# EAGLE design z_gauge_decoder_v1.0 (EAGLE 9.7.0)
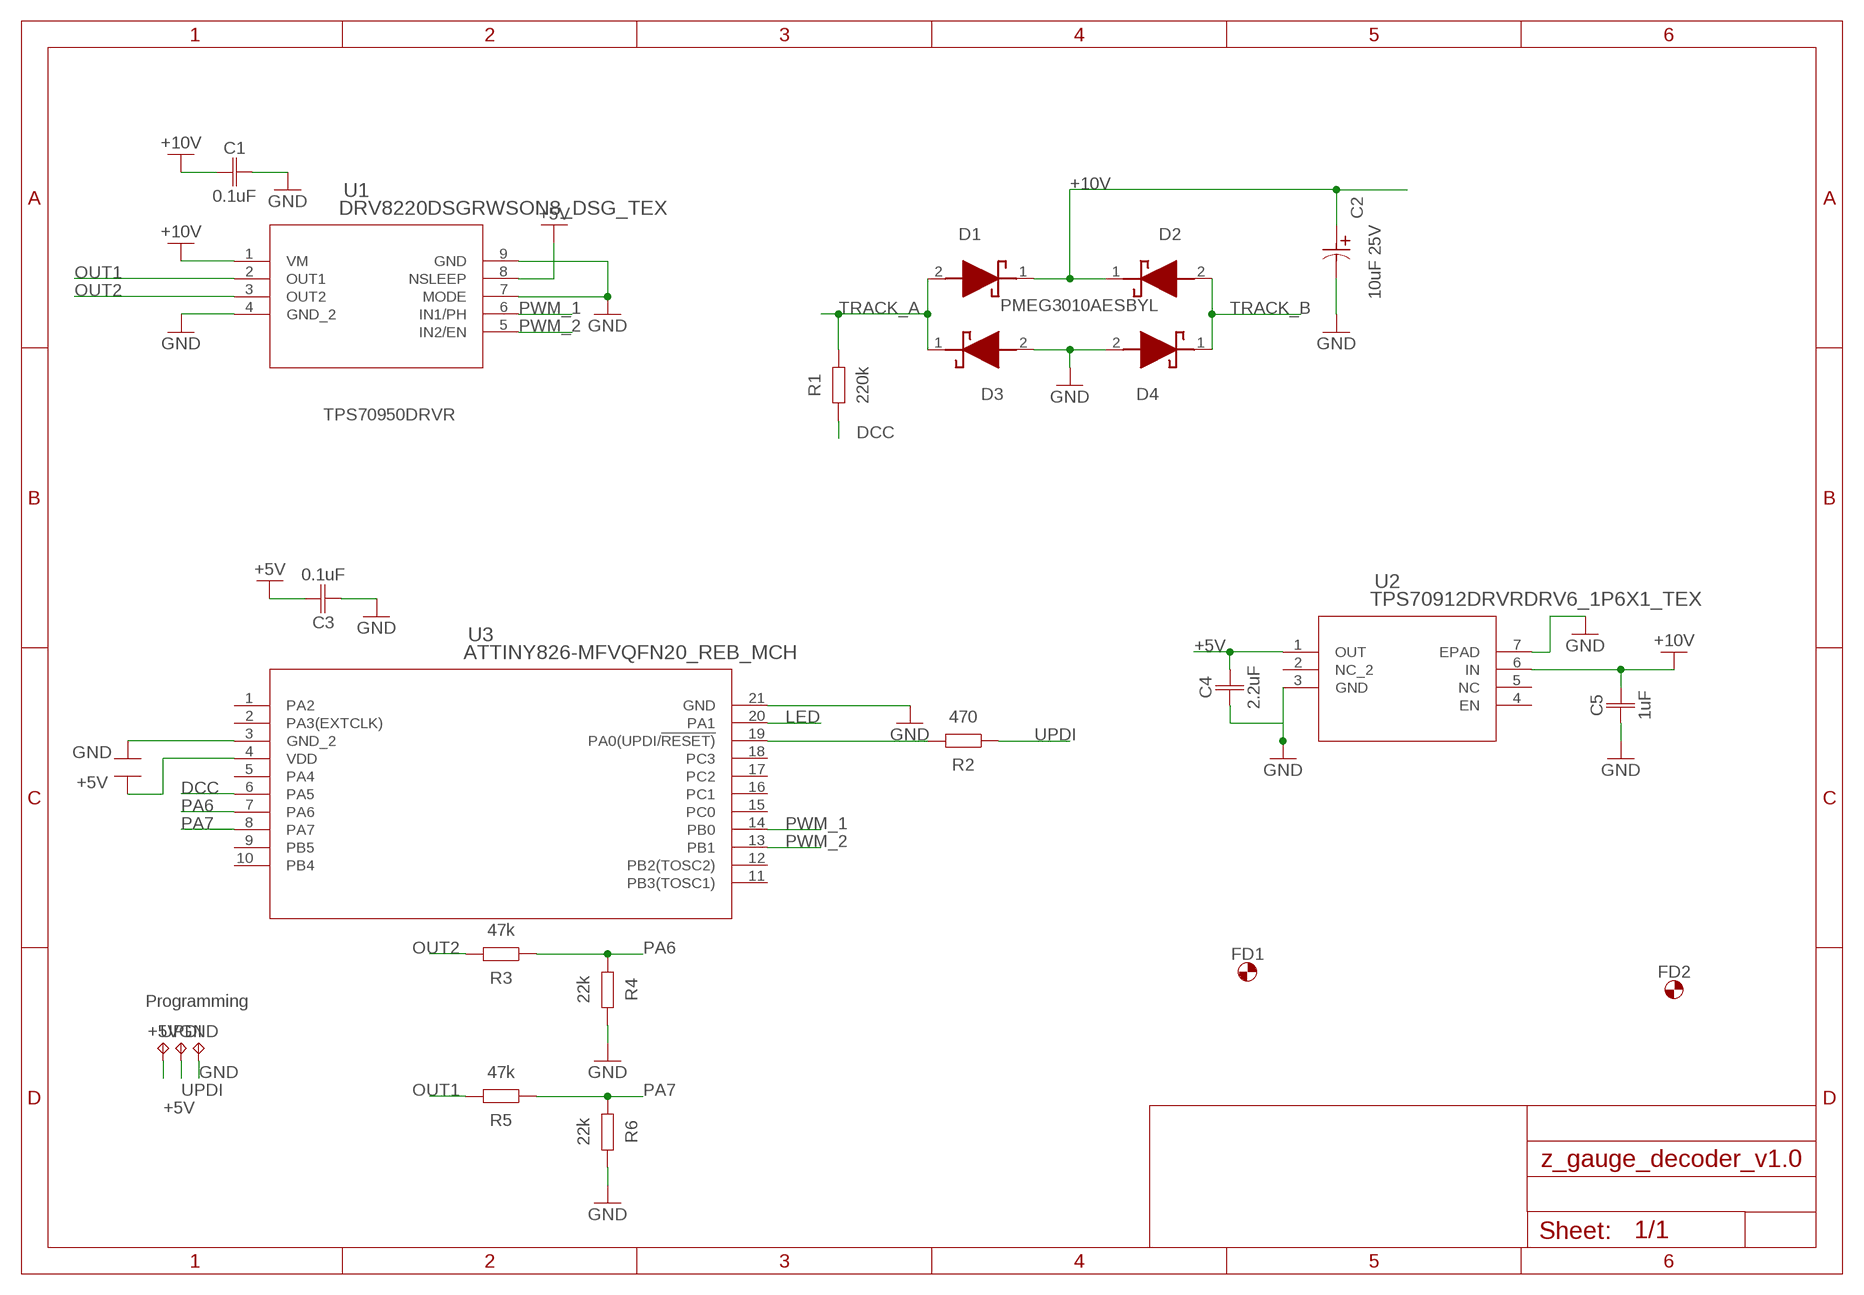
[diagram p0: schematic, sheet 1]

## Parts
+5V  TPTP127R  [TP127R]
C1  0.1uF  CCHIP-0201(0603METRIC)  [WE-MK_0201]
C2  10uF 25V  TAJA106K016RNJTAJA_AVX  [TAJA_AVX]
C3  0.1uF  CCHIP-0201(0603METRIC)  [WE-MK_0201]
C4  2.2uF  CCHIP-0201(0603METRIC)  [WE-MK_0201]
C5  1uF  CCHIP-0201(0603METRIC)  [WE-MK_0201]
D1  PMEG3010AESBYL  [PMEG3010AESBYL]
D2  PMEG3010AESBYL  [PMEG3010AESBYL]
D3  PMEG3010AESBYL  [PMEG3010AESBYL]
D4  PMEG3010AESBYL  [PMEG3010AESBYL]
FD1  FID_1MM_P  [FID_1MM_P]
FD2  FID_1MM_P  [FID_1MM_P]
GND  TPTP127R  [TP127R]
R1  220k  RCHIP-0201(0603METRIC)  [WCAP-CSGP_0201_H0.3]
R2  470  RCHIP-0201(0603METRIC)  [WCAP-CSGP_0201_H0.3]
R3  47k  RCHIP-0201(0603METRIC)  [WCAP-CSGP_0201_H0.3]
R4  22k  RCHIP-0201(0603METRIC)  [WCAP-CSGP_0201_H0.3]
R5  47k  RCHIP-0201(0603METRIC)  [WCAP-CSGP_0201_H0.3]
R6  22k  RCHIP-0201(0603METRIC)  [WCAP-CSGP_0201_H0.3]
U1  DRV8220DSGRWSON8_DSG_TEX  [WSON8_DSG_TEX]
U2  TPS70912DRVRDRV6_1P6X1_TEX  [DRV6_1P6X1_TEX]
U3  ATTINY826-MFVQFN20_REB_MCH  [VQFN20_REB_MCH]
UPDI  TPTP127R  [TP127R]

## Nets
+5V: +5V.TP C3.2 C4.2 U1.8(NSLEEP) U2.1(OUT) U3.4(VDD)
+10V: C1.1 C2.1 C5.2 D1.1(K) D2.1(K) U1.1(VM) U2.6(IN)
DCC: R1.1 U3.6(PA5)
GND: C1.2 C2.2 C3.1 C4.1 C5.1 D3.2(A) D4.2(A) GND.TP R4.2 R6.2 U1.4(GND_2) U1.7(MODE) U1.9(GND) U2.3(GND) U2.7(EPAD) U3.3(GND_2) U3.21(GND)
LED: U3.20(PA1)
N$1: R2.2 U3.19(PA0(UPDI/!RESET))
OUT1: R5.2 U1.2(OUT1)
OUT2: R3.2 U1.3(OUT2)
PA6: R3.1 R4.1 U3.7(PA6)
PA7: R5.1 R6.1 U3.8(PA7)
PWM_1: U1.6(IN1/PH) U3.14(PB0)
PWM_2: U1.5(IN2/EN) U3.13(PB1)
TRACK_A: D1.2(A) D3.1(K) R1.2
TRACK_B: D2.2(A) D4.1(K)
UPDI: R2.1 UPDI.TP
Unconnected: U2.2(NC_2) U2.4(EN) U2.5(NC) U3.1(PA2) U3.2(PA3(EXTCLK)) U3.5(PA4) U3.9(PB5) U3.10(PB4) U3.11(PB3(TOSC1)) U3.12(PB2(TOSC2)) U3.15(PC0) U3.16(PC1) U3.17(PC2) U3.18(PC3)

## Notes on the sheet
- TPS70950DRVR
- Programming

## Library data of the parts
+5V GND UPDI = PCB_Utilities:TP: Test Pad; CATEGORY_L1: Test Points; DESCRIPTION: Test Point Round 1.27mmx1.27mm
C1 C3 = Capacitor:C: Capacitor - Generic; CATEGORY_L1: Capacitor; MPN: GRM033R61E104KE14D
C2 = 2026-11-07_18-14-01_Library:TAJA106K016RNJ; COPYRIGHT: Copyright (C) 2026 Ultra Librarian. All rights reserved.; MANUFACTURER_NAME: KYOCERA AVX; MANUFACTURER_PART_NUMBER: TAJA106K016RNJ; MPN: TCJA106M025R0150E
C4 C5 = Capacitor:C: Capacitor - Generic; CATEGORY_L1: Capacitor
D1-D4 = PMEG3010AESBYL:PMEG3010AESBYL: Schottky Diodes & Rectifiers 1A MEGA Schottky Barrier Rectifier Source: Datasheet <https://assets.nexperia.com/documents/data-sheet/PMEG3010AESB.pdf>; ARROW_PART_NUMBER: PMEG3010AESBYL; ARROW_PRICE-STOCK: https://www.arrow.com/en/products/pmeg3010aesbyl/nexperia?region=nac; DESCRIPTION: Schottky Diodes & Rectifiers 1A MEGA Schottky Barrier Rectifier; HEIGHT: 0.3mm; MANUFACTURER_NAME: Nexperia; MANUFACTURER_PART_NUMBER: PMEG3010AESBYL; MOUSER_PART_NUMBER: 771-PMEG3010AESBYL; MOUSER_PRICE-STOCK: https://www.mouser.co.uk/ProductDetail/Nexperia/PMEG3010AESBYL?qs=bel5lzaZNxQRW0rEhdK%2FZQ%3D%3D
FD1 FD2 = PCB_Utilities:FID: Fiducial marks. Top and Bottom copper with stop mask; CATEGORY_L1: Fiducial Marks; DESCRIPTION: Fiducial Mark 1mm with solder paste; PACKAGE: Surface Mount
R1-R6 = Resistor:R: Resistor Fixed - Generic; CATEGORY_L1: Resistors
U1 = 2026-11-06_20-55-51_Library:DRV8220DSGR; COPYRIGHT: Copyright (C) 2026 Ultra Librarian. All rights reserved.; DATASHEET: https://www.ti.com/lit/gpn/drv8220; DESCRIPTION: 20-V, 1.76-A H-bridge motor driver with auto sleep mode 8-WSON -40 to 125; MANUFACTURER_NAME: Texas Instruments; MANUFACTURER_PART_NUMBER: DRV8220DSGR
U2 = 2026-11-06_21-08-21_Library:TPS70912DRVR; COPYRIGHT: Copyright (C) 2026 Ultra Librarian. All rights reserved.; DATASHEET: https://www.ti.com/lit/gpn/tps709; DESCRIPTION: 150-mA, 30-V, ultra-low-IQ, low-dropout voltage regulator with reverse current protection and enable 6-WSON -40 to 125; MANUFACTURER_NAME: Texas Instruments; MANUFACTURER_PART_NUMBER: TPS70912DRVR
U3 = 2026-11-06_21-22-19_Library:ATTINY826-MF; COPYRIGHT: Copyright (C) 2026 Ultra Librarian. All rights reserved.; MANUFACTURER_NAME: Microchip; MANUFACTURER_PART_NUMBER: ATTINY826-MF

## Board
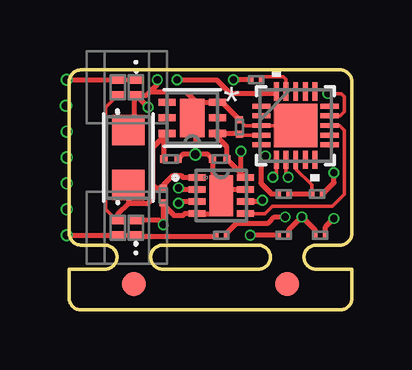
[diagram p1: board, top side]
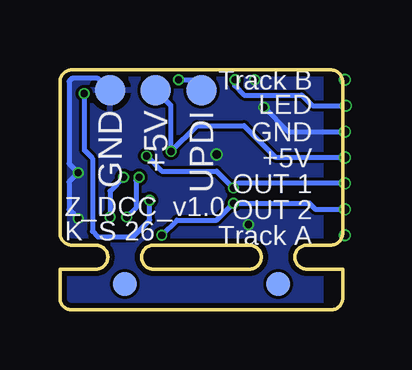
[diagram p2: board, bottom side, seen from below]

Size 11.8 x 10 mm. Coordinates in mm from the lower left corner, seen from the top.
Outline: 3.9,2.7 arc180 3.9,1.7 7.9,1.7 arc180 7.9,2.7 3.9,2.7
Outline: 11.3,2.7 arc90 11.8,3.2 11.8,9.5 arc90 11.3,10 0.5,10 arc90 0,9.5 0,3.2 arc90 0.5,2.7 1.5,2.7 arc-180 1.5,1.7 0,1.7 0,0.5 arc90 0.5,0 11.3,0 arc90 11.8,0.5 11.8,1.7 10.3,1.7 arc-180 10.3,2.7 11.3,2.7
Copper layers (1*16): Top 0.035mm / dielectric 1.6mm / Bottom 0.035mm
Design rules "jlcpcb-2layers.dru *": minimum track width 5mil, minimum drill 0.3mm, track to track 5mil, track to pad 5mil, pad to pad 5mil, via to via 5mil, smd to smd 5mil, copper to edge 0.2mm, drill to drill 6mil, minimum pad ring 10mil, minimum via ring 3mil, stop-mask expansion 4mil, vias tented up to drill 0mil, thermal gap 10mil
tRestrict: area 1.7,2.5 to 3.9,2.9

### Footprints (pad centres in the part's own frame; a part is rotated, then mirrored left to right if it is on the bottom)
TP127R = smd 1.27 x 1.27: TP 0,0
WE-MK_0201 = smd 0.3 x 0.3: 1 -0.3,0; 2 0.3,0
TAJA_AVX = smd 1.27 x 1.346: 1 -1.143,0; 2 1.143,0
PMEG3010AESBYL = smd 0.35 x 0.6: 1 -0.325,0; 2 0.325,0
FID_1MM_P = smd 1 x 1 bottom: FIDB 0,0 | smd 1 x 1: FIDT 0,0
WCAP-CSGP_0201_H0.3 = smd 0.21 x 0.3: 1 0.22,0; 2 -0.22,0
WSON8_DSG_TEX = smd 0.711 x 0.279: 1 -1.003,0.75; 2 -1.003,0.25; 3 -1.003,-0.25; 4 -1.003,-0.75; 5 1.003,-0.75; 6 1.003,-0.25; 7 1.003,0.25; 8 1.003,0.75 | smd 0.991 x 1.702: 9 0,0
DRV6_1P6X1_TEX = smd 0.7 x 0.3: 1 -1.05,0.65; 2 -1.05,0; 3 -1.05,-0.65; 4 1.05,-0.65; 5 1.05,0; 6 1.05,0.65 | smd 1.016 x 1.6: 7 0,0
VQFN20_REB_MCH = smd 0.762 x 0.203: 1 -1.422,0.8; 2 -1.422,0.4; 3 -1.422,0; 4 -1.422,-0.4; 5 -1.422,-0.8; 11 1.422,-0.8; 12 1.422,-0.4; 13 1.422,0; 14 1.422,0.4; 15 1.422,0.8 | smd 0.203 x 0.762: 6 -0.8,-1.422; 7 -0.4,-1.422; 8 0,-1.422; 9 0.4,-1.422; 10 0.8,-1.422; 16 0.8,1.422; 17 0.4,1.422; 18 0,1.422; 19 -0.4,1.422; 20 -0.8,1.422 | smd 1.803 x 1.803: 21 0,0

### Placement (x,y rotation side)
+5V  7.81,9.14 180 bottom
C1  3.93,4.76 270 top
C2  2.47,6.35 90 top
C3  7.11,7.62 270 top
C4  6.28,6.29 0 top
C5  4.25,6.29 180 top
D1  2.03,3.43 270 top
D2  2.03,9.27 90 top
D3  2.79,3.43 90 top
D4  2.79,9.27 270 top
FD1  2.7,1.08 0 top
FD2  9.1,1.08 0 top
GND  9.71,9.14 180 bottom
R1  6.34,3.11 0 top
R2  7.81,9.59 180 top
R3  8.95,3.11 0 top
R4  10.47,3.11 180 top
R5  8.95,4.83 0 top
R6  10.35,4.83 180 top
U1  6.34,4.76 0 top
U2  5.14,8 180 top
U3  9.45,7.68 0 top
UPDI  5.9,9.14 180 bottom

### Tracks (layer width: path | path; a pad name or v marks a point on that pad's centre or on a via)
+5V  (via drill 0.3)
  Top 0.152: U3.4 7.14,7.28 C3.2
  Top 0.203: C3.2 7.08,7.35 U2.1 6.19,7.19 6.58,6.79 C4.2 7.17,5.69 | U1.8 7.17,5.69 | 7.17,5.69 v7.17,6.6
  Bottom 0.203: +5V.TP 7.17,8.51 v7.17,6.6 6.09,7.68 4.12,7.68 2.79,6.35 -0.09,6.35
+10V
  Top 0.152: D1.1 1.96,3.75 1.52,4.19 1.52,8.45 2.02,8.95 D2.1
  Top 0.203: C2.1 2.47,4.44 | D1.1 2.03,4 2.47,4.44 | 2.47,4.44 3.3,4.44 3.49,4.64 3.49,5.21 | 3.49,5.21 3.49,6.75 U2.6 3.95,7.21 C5.2 | U1.1 4.77,5.51 4.69,5.59 4.31,5.59 3.93,5.21 C1.1 3.63,5.06 3.49,5.21
DCC  (via drill 0.3)
  Top 0.152: U3.6 8.65,5.67 v8.5,5.52
  Top 0.203: R1.1 6.56,3.2 6.98,3.62 8.31,3.62 8.57,3.87 v9.01,3.87
  Bottom 0.203: v9.01,3.87 8.63,4.25 8.63,5.4 v8.5,5.52
GND  (via drill 0.3, 0.35)
  Top 0.152: C3.1 7.34,7.68 U3.3 U3.21
  Top 0.203: C2.2 2.73,7.75 2.73,8.89 2.79,8.89 | 2.79,8.89 D4.2 3.23,8.95 3.36,9.07 | D3.2 3.74,3.75 v3.93,3.56 C1.2 3.93,4.38 4.38,3.94 4.76,3.94 4.83,4.01 U1.4 5.9,4.01 6.35,4.46 U1.9 | 3.36,9.07 4.89,9.07 5.27,8.7 | v5.27,6.48 5.27,7.87 U2.7 5.27,8.13 5.27,8.7 | 5.27,8.7 5.33,8.64 6.17,8.64 U2.3 6.38,8.65 C3.1 | 3.36,9.07 3.68,9.39 v3.68,9.59 | 2.79,8.89 2.85,8.89 v3.3,8.45 | v11.04,3.81 10.69,3.46 R4.2 | R6.2 11.04,5.3 v11.04,5.71 | v5.27,6.48 4.74,6.48 C5.1 | v5.27,6.48 5.79,6.48 C4.1 5.98,5.71 6.35,5.35 U1.9 | U1.7 6.6,5.01 U1.9
  Bottom 0.203: v3.3,8.45 2.28,7.43 -0.09,7.43 | v11.04,3.81 11.42,4.19 11.42,5.33 v11.04,5.71 11.42,6.1 11.42,9.52 11.3,9.65 10.22,9.65 GND.TP 9.71,9.08
  pour Bottom: 0.92,0.1 12.15,0.1 12.15,10.06 0.92,10.06
LED  (via drill 0.3)
  Top 0.203: U3.20 8.56,9.02 6.73,9.02 6.15,9.59 v4.5,9.59
  Bottom 0.203: v4.5,9.59 4.5,9.33 4.12,8.95 1.71,8.95 1.26,8.51 -0.09,8.51
N$1
  Top 0.152: U3.19 9.05,9.62 8.95,9.71 8.15,9.71 R2.2
N$2  (via drill 0.35)
  other vias: -0.09,9.59
N$3  (via drill 0.35)
  other vias: -0.13,8.51
N$4  (via drill 0.35)
  other vias: -0.09,7.43
N$5  (via drill 0.35)
  other vias: -0.09,6.35
N$6  (via drill 0.35)
  other vias: -0.09,5.27
N$7  (via drill 0.35)
  other vias: -0.09,4.19
N$8  (via drill 0.35)
  other vias: -0.09,3.11
OUT1  (via drill 0.3)
  Top 0.203: U1.2 4.63,5.01 v4.57,5.08 | R5.2 8.46,4.83 8,5.29 8,6.22 v8.19,6.41
  Bottom 0.203: v8.19,6.41 7.55,5.78 5.27,5.78 v4.57,5.08 4.38,5.27 -0.09,5.27
OUT2  (via drill 0.3)
  Top 0.203: U1.3 4.63,4.51 v4.57,4.44 | R3.2 v7.55,3.11
  Bottom 0.203: -0.09,4.19 1.14,4.19 1.39,4.44 v4.57,4.44 5.27,3.75 6.92,3.75 v7.55,3.11
PA6  (via drill 0.3)
  Top 0.152: U3.7 9.05,5.61 v9.14,5.52
  Top 0.203: R3.1 9.17,3.33 v9.71,3.87 10.25,3.33 R4.1
  Bottom 0.203: v9.14,5.52 9.71,4.95 v9.71,3.87
PA7
  Top 0.152: R6.1 10.12,5.21 9.45,5.88 U3.8
  Top 0.203: R6.1 R5.1
PWM_1  (via drill 0.3)
  Top 0.152: U3.14 11.32,8.08 11.49,8.25 11.49,8.89 11.36,9.02 v10.79,9.02
  Top 0.203: v8.06,4.57 8,4.51 U1.6
  Bottom 0.203: v10.79,9.02 10.79,6.67 10.44,6.32 10.44,3.27 10.22,3.05 8.76,3.05 8.06,3.75 v8.06,4.57
PWM_2
  Top 0.152: U3.13 11.3,7.68 11.49,7.49 11.49,4.83 10.98,4.32 8.48,4.32 8.17,4.01 U1.5
TRACK_A
  Top 0.203: -0.09,3.11 2.02,3.11 D1.2 D3.1 2.85,3.04 6.05,3.04 R1.2
TRACK_B
  Top 0.203: -0.09,9.59 2.02,9.59 D2.2 D4.1
UPDI  (via drill 0.3)
  Top 0.203: R2.1 v6.85,9.59
  Bottom 0.203: v6.85,9.59 5.9,9.59 UPDI.TP

### Text on the board
bNames: Track B | LED | GND | +5V | OUT 1 | OUT 2 | Z_DCC_v1.0 | Track A | K_S 26